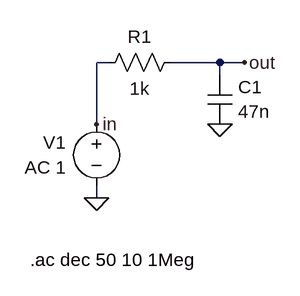
[diagram p0: schematic rc.asc]
rc.asc, the LTspice schematic file:
Version 4
SHEET 1 880 680
WIRE 160 272 160 288
WIRE 320 128 320 112
WIRE 320 112 256 112
WIRE 320 112 352 112
WIRE 176 112 160 112
WIRE 160 112 160 192
FLAG 160 288 0
FLAG 320 192 0
FLAG 352 112 out
FLAG 160 192 in
SYMBOL voltage 160 176 R0
WINDOW 0 -40 40 Right 2
WINDOW 3 -40 72 Right 2
SYMATTR InstName V1
SYMATTR Value AC 1
SYMBOL res 160 128 R270
WINDOW 0 34 56 VTop 2
WINDOW 3 -2 56 VBottom 2
SYMATTR InstName R1
SYMATTR Value 1k
SYMATTR SpiceLine tc1=2m
SYMBOL cap 304 128 R0
WINDOW 0 40 16 Left 2
WINDOW 3 40 48 Left 2
SYMATTR InstName C1
SYMATTR Value 47n
TEXT 74 368 Left 2 !.ac dec 50 10 1Meg

The netlist it stands for:
* rc.asc
V1 in 0 AC 1
R1 in out 1k tc1=2m
C1 out 0 47n
.ac dec 50 10 1Meg
.backanno
.end